# EasyEDA Pro project ProPrj_Codex_key_2026-10-20_10-08-15_2026-11-04.epro, schematic CpuSchematic1

## Sheets
1 P1: Assembly Variant: Basic; Board Name: Board2; Create Date: 2026-10-20; Page Name: P1; Project Name: Codex_key_2026-10-20_10-08-15; Schematic Name: Schematic1; Update Date: 2026-10-20; Company: 嘉立创EDA; Page Size: A4; Version: V1.0
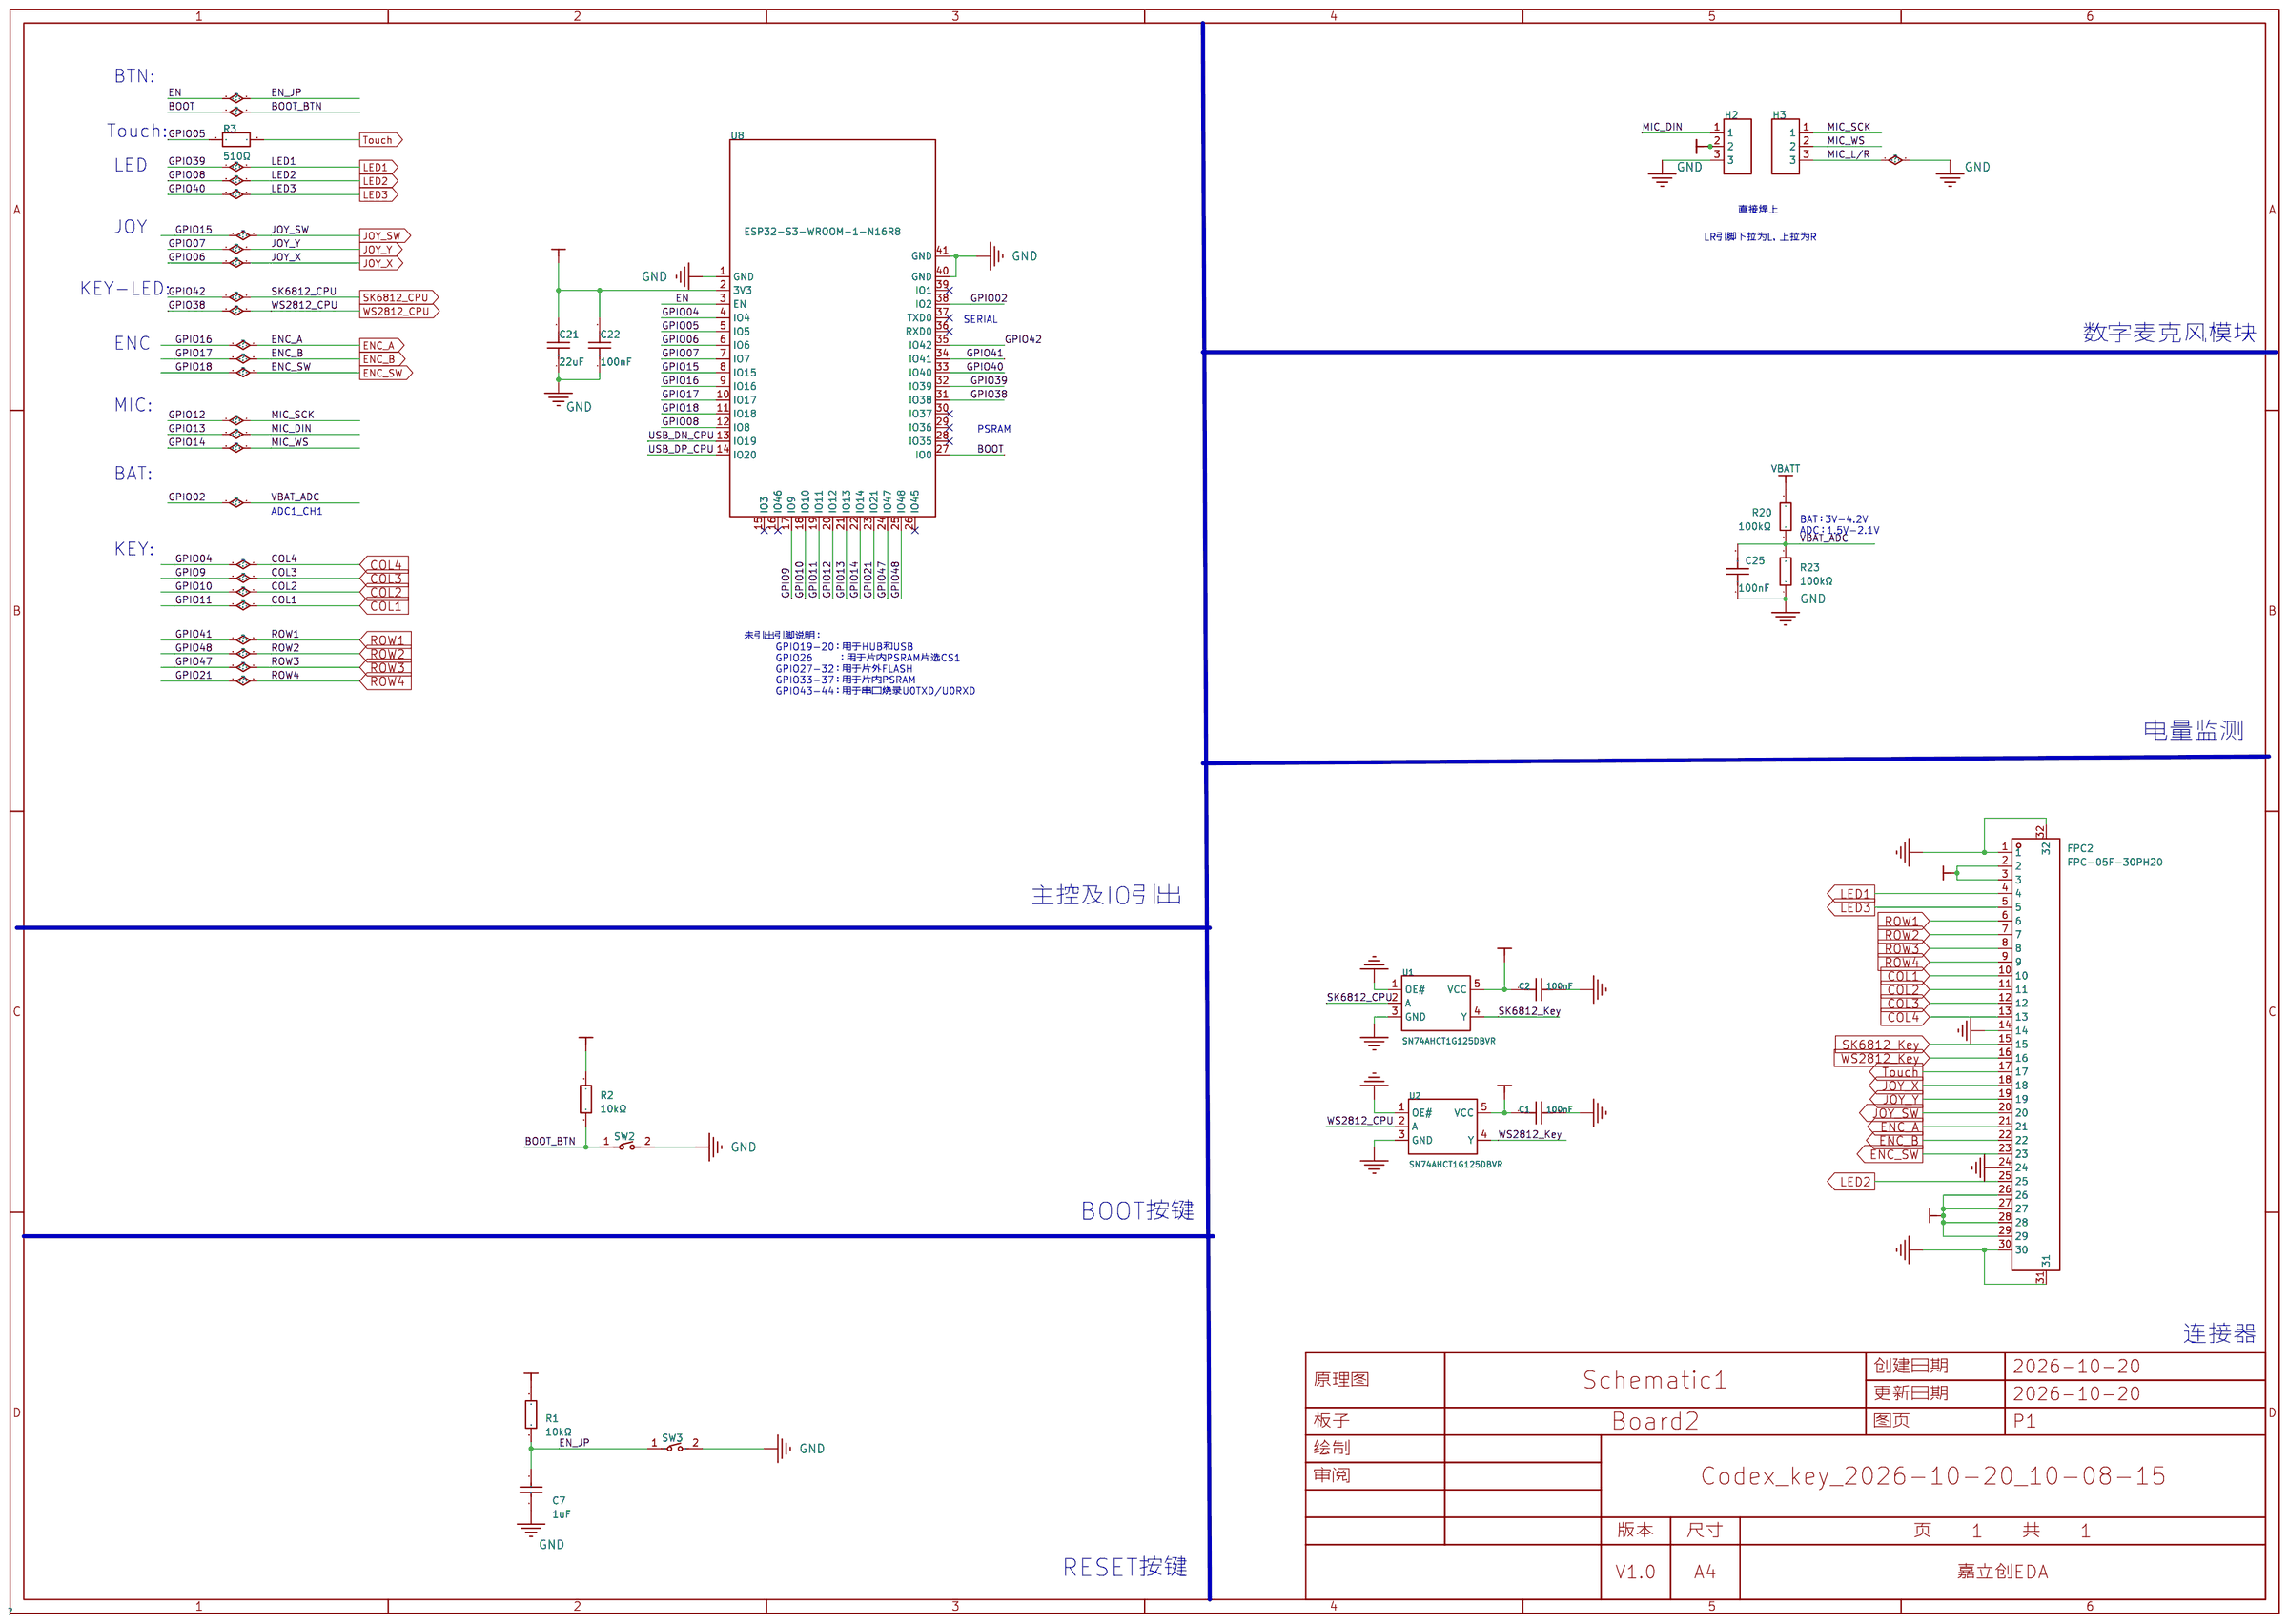
[diagram p2: P1]
2 P2: Board Name: CpuBoard2; Page Name: P2; Schematic Name: CpuSchematic1
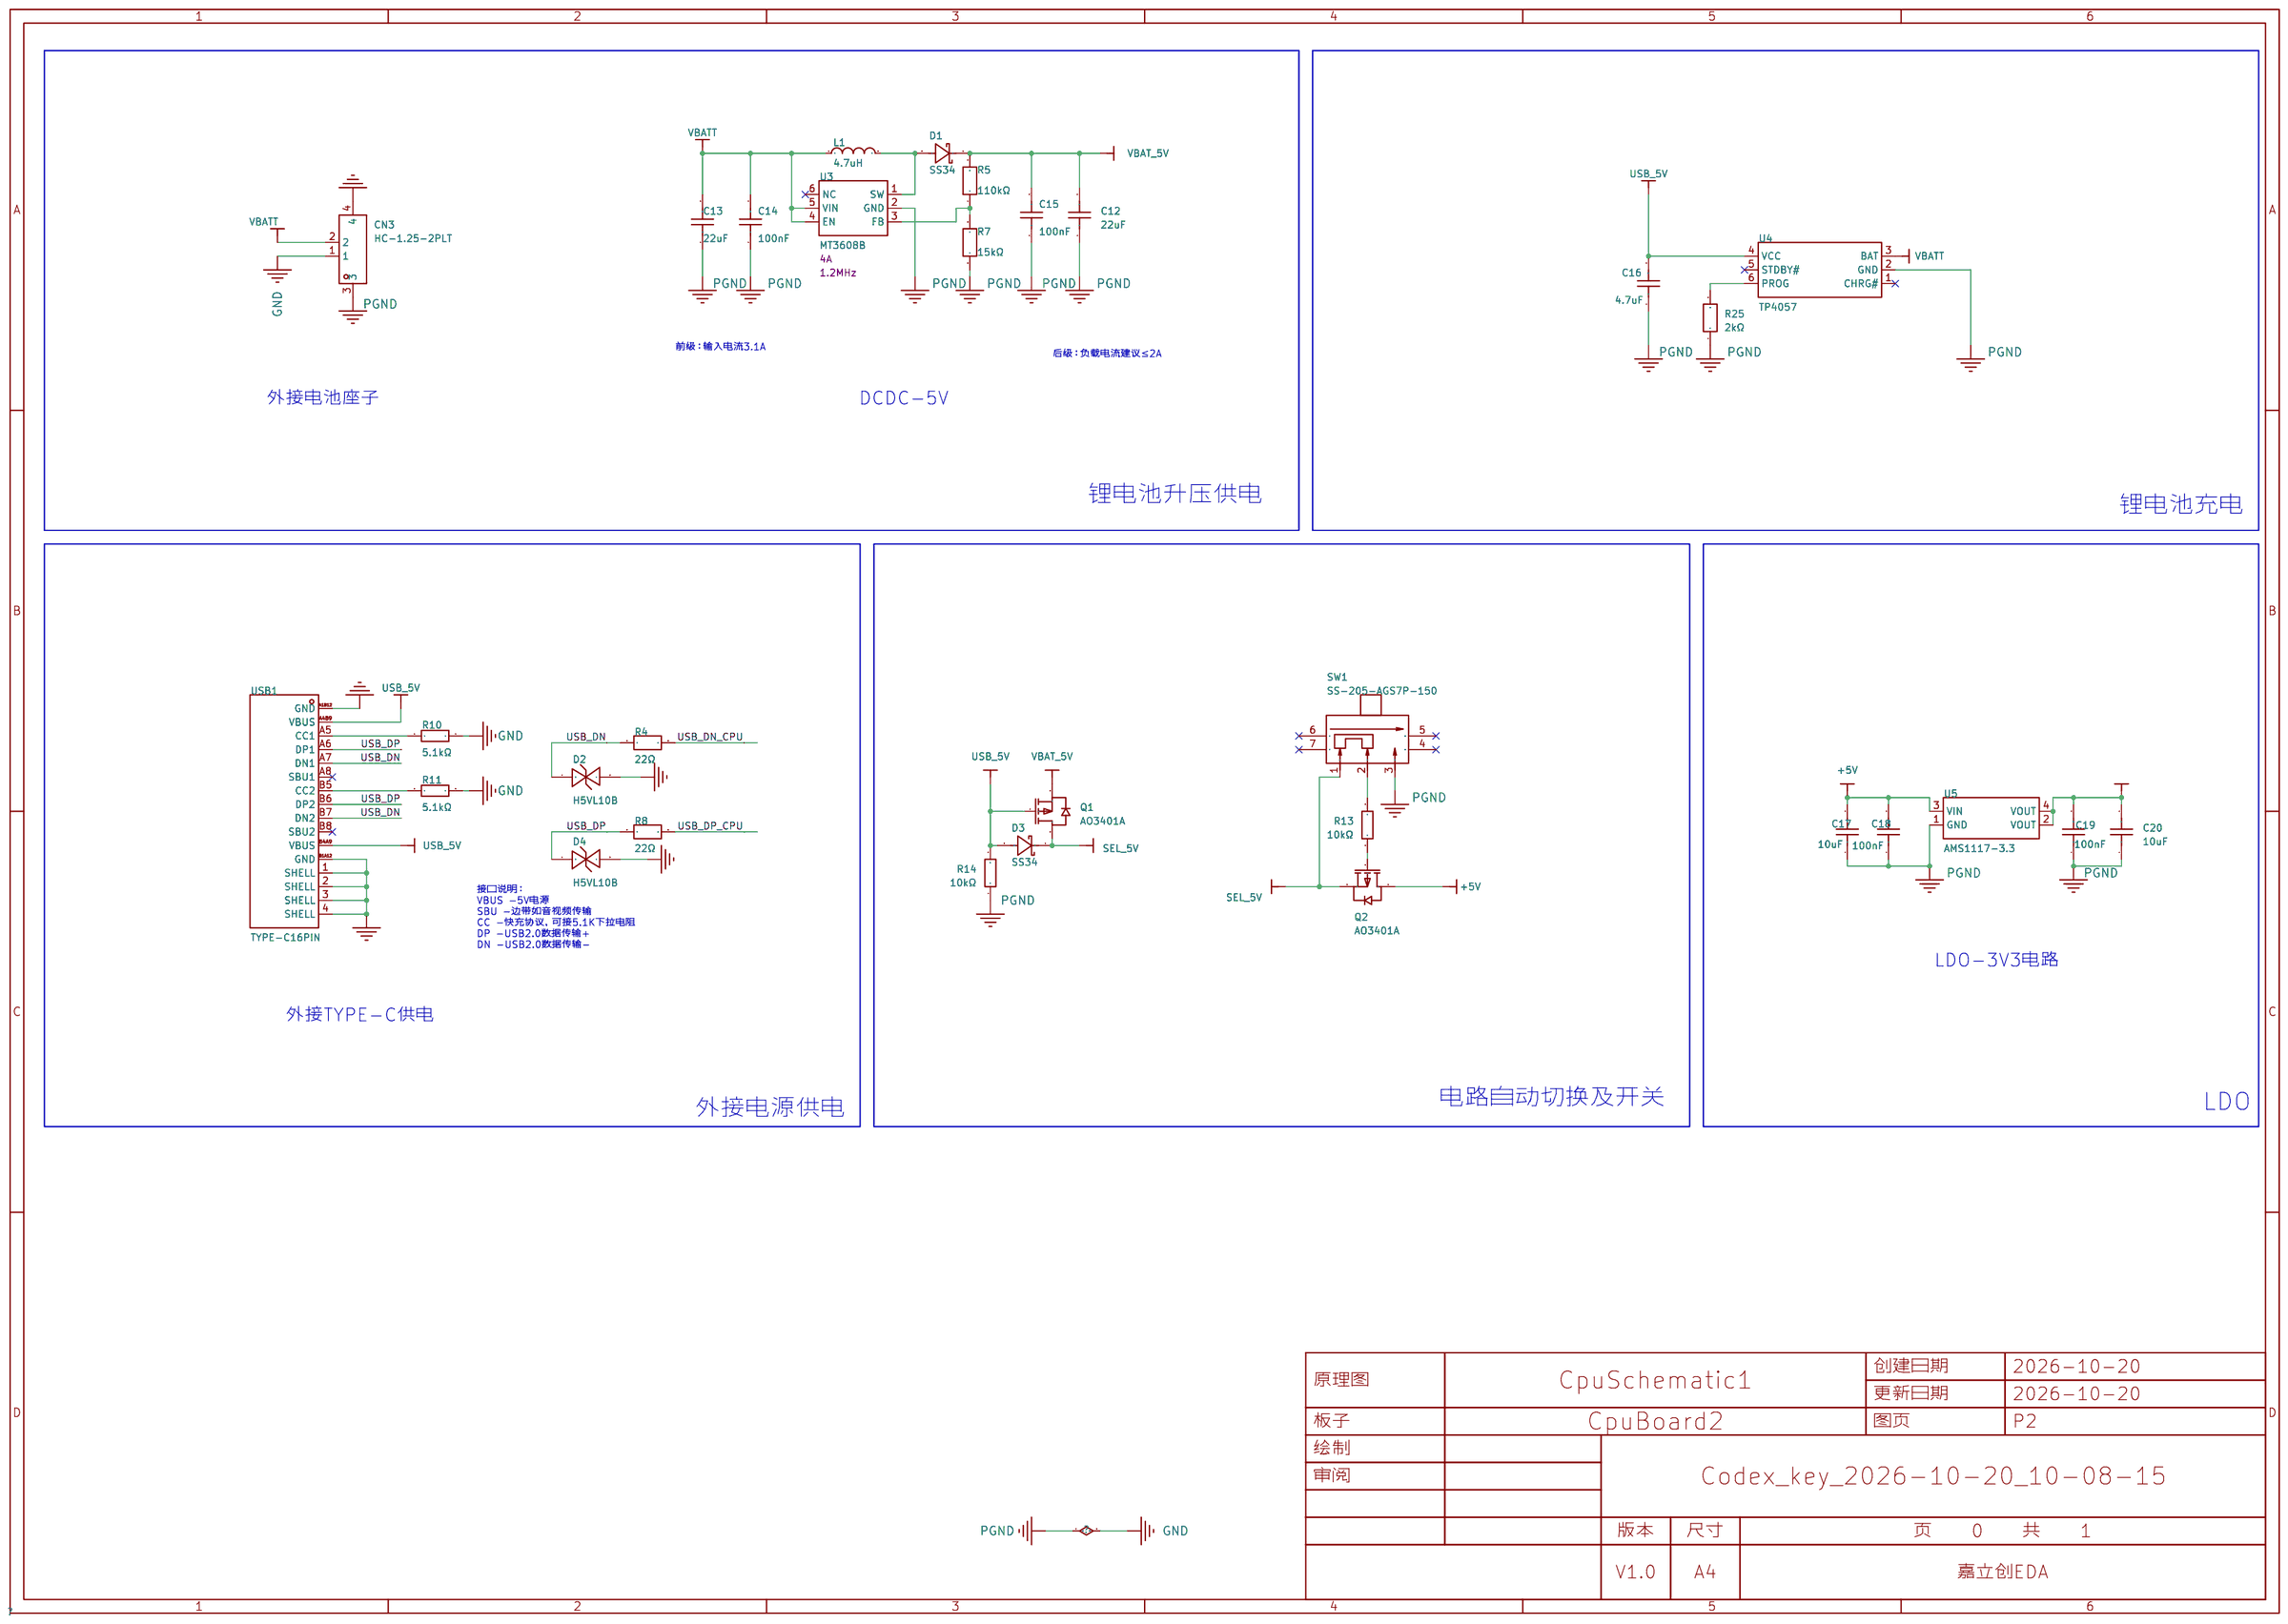
[diagram p3: P2]

## Parts
sheet P1
C1  100nF  [C0603]
C2  100nF  [C0603]
C7  1uF  [C0402]
C21  22uF  [C0603]
C22  100nF  [C0603]
C25  100nF  [C0603]
FPC2  FPC-05F-30PH20  [FPC-SMD_30P-P0.50_XUNPU_FPC-05F-30PH20]
H2  FH2.54-09-03PZD  [HDR-TH_3P-P2.54-V-F]  (no BOM)
H3  FH2.54-09-03PZD  [HDR-TH_3P-P2.54-V-F]  (no BOM)
R1  10kΩ  [R0402]
R2  10kΩ  [R0402]
R3  510Ω  [R0402]
R20  100kΩ  [R0603]
R23  100kΩ  [R0603]
SW2  ZX-QC34-2TPDZ  [KEY-SMD_L3.9-W3.0-LS5.0-EH]
SW3  ZX-QC34-2TPDZ  [KEY-SMD_L3.9-W3.0-LS5.0-EH]
U1  SN74AHCT1G125DBVR  [SOT-23-5_L3.0-W1.7-P0.95-LS2.8-BR]
U2  SN74AHCT1G125DBVR  [SOT-23-5_L3.0-W1.7-P0.95-LS2.8-BR]
U8  ESP32-S3-WROOM-1-N16R8  [WIRELM-SMD_ESP32-S3-WROOM-1]
sheet P2
C12  22uF  [C0603]
C13  22uF  [C0603]
C14  100nF  [C0603]
C15  100nF  [C0603]
C16  4.7uF  [C0603]
C17  10uF  [C0603]
C18  100nF  [C0603]
C19  100nF  [C0603]
C20  10uF  [C0603]
CN3  HC-1.25-2PLT  [CONN-SMD_HC-1.25-2PLT]
D1  SS34  [SMA_L4.2-W2.7-LS5.0-RD]
D2  H5VL10B  [SOD-882_L1.0-W0.6-BI]
D3  SS34  [SMA_L4.2-W2.7-LS5.0-RD]
D4  H5VL10B  [SOD-882_L1.0-W0.6-BI]
L1  4.7uH  [IND-SMD_L4.0-W4.0_LVS404018]
Q1  AO3401A  [SOT-23_L2.9-W1.3-P1.90-LS2.4-BR]
Q2  AO3401A  [SOT-23_L2.9-W1.3-P1.90-LS2.4-BR]
R4  22Ω  [R0402]
R5  110kΩ  [R0603]
R7  15kΩ  [R0603]
R8  22Ω  [R0402]
R10  5.1kΩ  [R0603]
R11  5.1kΩ  [R0603]
R13  10kΩ  [R0603]
R14  10kΩ  [R0603]
R25  2kΩ  [R0603]
SW1  SS-205-AGS7P-150  [SW-SMD_SS-205-AGS7P-150]
U3  MT3608B  [SOT-23-6_L2.9-W1.6-P0.95-LS2.8-BR]
U4  TP4057  [SOT-23-6_L2.9-W1.6-P0.95-LS2.8-BL]
U5  AMS1117-3.3  [SOT-223-3_L6.7-W3.7-P2.30-LS7.0-BR]
USB1  TYPE-C16PIN  [USB-C-SMD_TYPE-C16PIN]

## Library data of the parts
C1 C2 = CC0603KRX7R9BB104: 容值:100nF;精度:±10%;额定电压:50V;温度系数:X7R;; LCSC Part Name: 100nF ±10% 50V; Supplier Part: C14663; Manufacturer: YAGEO(国巨); Supplier Footprint: 0603; JLCPCB Part Class: Basic Part; Datasheet: https://item.szlcsc.com/datasheet/CC0603KRX7R9BB104/15331.html; Supplier: LCSC; Tolerance: ±10%; Voltage Rating: 50V; Temperature Coefficient: X7R
C7 = CL05B104KO5NNNC: 容值:100nF;精度:±10%;额定电压:16V;材质(温度系数):X7R;; LCSC Part Name: 100nF ±10% 16V; Supplier Part: C52923; Manufacturer: SAMSUNG(三星); Manufacturer Part: CL05A105KA5NQNC; Supplier Footprint: 0402; Datasheet: https://atta.szlcsc.com/upload/public/pdf/source/20160218/1457707763339.pdf; Supplier: LCSC; Tolerance: ±10%; Voltage Rated: 16V; Temperature Coefficient: X7R; Check: true
C21 = CL10A226MP8NUNE: 容值:22uF;精度:±20%;额定电压:10V;材质(温度系数):X5R;; LCSC Part Name: 22uF ±20% 10V; Supplier Part: C86295; Manufacturer: SAMSUNG(三星); Supplier Footprint: 0603; JLCPCB Part Class: Extended Part; Datasheet: https://atta.szlcsc.com/upload/public/pdf/source/20160218/1457707763339.pdf; Supplier: LCSC; Tolerance: ±20%; Voltage Rated: 10V; Temperature Coefficient: X5R
C18 C19 C22 = CL10B104KB8NNNC: 容值:100nF;精度:±10%;额定电压:50V;材质(温度系数):X7R;; LCSC Part Name: 100nF ±10% 50V; Supplier Part: C1591; Manufacturer: SAMSUNG(三星); Supplier Footprint: 0603; JLCPCB Part Class: Extended Part; Datasheet: https://atta.szlcsc.com/upload/public/pdf/source/20160218/1457707763339.pdf; Supplier: LCSC; Tolerance: ±10%; Voltage Rated: 50V; Temperature Coefficient: X7R
C14 C15 C25 = CL10B104KB8NNNC: 容值:100nF;精度:±10%;额定电压:50V;温度系数:X7R;; LCSC Part Name: 100nF ±10% 50V; Supplier Part: C1591; Manufacturer: SAMSUNG(三星); Supplier Footprint: 0603; JLCPCB Part Class: Extended Part; Datasheet: https://item.szlcsc.com/datasheet/CL10B104KB8NNNC/1943.html; Supplier: LCSC; Tolerance: ±10%; Voltage Rated: 50V; Temperature Coefficient: X7R; Voltage Rating: 50V
FPC2 = FPC-05F-30PH20: 锁定特性:翻盖式;触点类型:下接;触点数量:30P;间距:0.5mm;安装方式:卧贴;工作温度:-25℃~+85℃;; LCSC Part Name: 翻盖式 下接 P数:30P 间距:0.5mm; Supplier Part: C2856808; Manufacturer: XUNPU(讯普); Supplier Footprint: SMD,P=0.5mm,卧贴; JLCPCB Part Class: Extended Part; Datasheet: https://item.szlcsc.com/datasheet/FPC-05F-30PH20/3056906.html; Supplier: LCSC; Locking Feature: 翻盖式; Contact Type: 下接; Number of Contacts: 30P; Pitch: 0.5mm; Mounting Type: 卧贴; FFC, FCB Thickness: 0.3mm; Height Above Board: 2mm; Contact Material: 磷青铜; Contact Plating: 锡; Operating Temperature: -25℃~+85℃; Rated Voltage (Max): 50V; Current Rating (Max): 500mA
H2 H3 = FH2.54-09-03PZD: 插孔结构:1x3P;间距:2.54mm;圆孔/方孔:方孔;安装方式:直插;排数:单排;总孔位数:3P;额定电流:3A;插孔方向:顶部;塑高:8.5mm;触头材质:磷青铜;触头镀层:金;工作温度:-40℃~+105℃;; LCSC Part Name: 1x3P 间距:2.54mm 直插; Supplier Part: C7500772; Manufacturer: XUNPU(讯普); Supplier Footprint: 插件,P=2.54mm; JLCPCB Part Class: Extended Part; Datasheet: https://item.szlcsc.com/datasheet/FH2.54-09-03PZD/8579576.html; Supplier: LCSC; Holes Structure: 1x3P; Pitch: 2.54mm; Circular Hole / Square Hole: 方孔; Mounting Type: 直插; Number of Rows: 单排; Number of Positions: 3P; Current Rating: 3A; Holes Direction: 顶部; Insulation Height: 8.5mm; Contact Material: 磷青铜; Contact Plating: 金; Operating Temperature: -40℃~+105℃; PIN Length: 3.2mm
R1 R2 = 0402WGF1002TCE: 电阻类型:厚膜电阻;阻值:10kΩ;精度:±1%;功率:62.5mW;温度系数:±100ppm/℃;; LCSC Part Name: 厚膜电阻 10kΩ ±1% 62.5mW; Supplier Part: C25744; Manufacturer: UNI-ROYAL(厚声); Supplier Footprint: 0402; Datasheet: https://atta.szlcsc.com/upload/public/pdf/source/20200306/C422600_1E6D84923E4A46A82E41ADD87F860B5C.pdf; Supplier: LCSC; Type: 厚膜电阻; Tolerance: ±1%; Power(Watts): 62.5mW; Temperature Coefficient: ±100ppm/℃; Overload Voltage (Max): 50V; Operating Temperature Range: -55℃~+155℃; Check: true
R3 = FRC0402F5100TS: 电阻类型:厚膜电阻;阻值:510Ω;精度:±1%;功率:62.5mW;工作电压:50V;温度系数:±100ppm/℃;; LCSC Part Name: 510Ω ±1% 62.5mW 厚膜电阻; Supplier Part: C2909366; Manufacturer: FOJAN(富捷); Supplier Footprint: 0402; JLCPCB Part Class: Extended Part; Datasheet: https://item.szlcsc.com/datasheet/FRC0402F5100TS/3186301.html; Supplier: LCSC; Type: 厚膜电阻; Tolerance: ±1%; Power(Watts): 62.5mW; Voltage-Supply(Max): 50V; Temperature Coefficient: ±100ppm/℃; Operating Temperature: -55℃~+155℃
R20 R23 = FRC0603J104 TS: 电阻类型:厚膜电阻;阻值:100kΩ;精度:±5%;功率:100mW;工作电压:75V;温度系数:±100ppm/℃;; LCSC Part Name: 100kΩ ±5% 100mW 厚膜电阻; Supplier Part: C2907088; Manufacturer: FOJAN(富捷); Supplier Footprint: 0603; JLCPCB Part Class: Extended Part; Datasheet: https://item.szlcsc.com/datasheet/FRC0603J104%2520TS/3180601.html; Supplier: LCSC; Type: 厚膜电阻; Tolerance: ±5%; Power(Watts): 100mW; Voltage-Supply(Max): 75V; Temperature Coefficient: ±100ppm/℃; Operating Temperature: -55℃~+155℃
SW2 SW3 = ZX-QC34-2TPDZ: 电路结构:单刀单掷;按钮形状:圆形按钮;作用力:2.6N;安装方式:立贴;开关长度:3mm;开关宽度:4mm;开关高度:2mm;带支架:不带支架;触点电流:50mA;额定电压:12V;工作寿命:10万次;; LCSC Part Name: 3*4*2贴片开关带柱; Supplier Part: C7470219; Manufacturer: Megastar(兆星); Supplier Footprint: SMD,4x3mm; JLCPCB Part Class: Extended Part; Datasheet: https://item.szlcsc.com/datasheet/ZX-QC34-2TPDZ/8519225.html; Supplier: LCSC; Circuit: 单刀单掷; Actuator Style: 圆形按钮; Operating Force: 2.6N; Mounting Type: 立贴; Length: 3mm; Width: 4mm; Switch Height: 2mm; with Bracket: 不带支架; Contact Current: 50mA; Voltage Rating: 12V; Actuator/Cap Color: 黑色; Termination Style: 鸥翼型; Life: 10万次; Operating Temperature: -30℃~+80℃
U1 U2 = SN74AHCT1G125DBVR: 输入类型:-;工作电压:4.5V~5.5V;元件数:1;每个元件位数:1;灌电流(IOL):8mA;拉电流(IOH):8mA;; LCSC Part Name: 三态输出，单路总线缓冲门; Supplier Part: C7484; Manufacturer: TI(德州仪器); Supplier Footprint: SOT-23-5; JLCPCB Part Class: Extended Part; Datasheet: https://www.ti.com/cn/lit/ds/symlink/sn74ahct1g125.pdf; Supplier: LCSC; output type: 三态; Voltage - Supply: 4.5V~5.5V; Number of Elements: 1; Number of Bits per Element: 1; Channel Type: 单向; Current - Output Low(IOL): 8mA; Current - Output High(IOH): 8mA; Logic Family: 74AHCT; Operating Temperature: -40℃~+125℃; Quiescent Current: 10uA; Propagation Delay: 6.5ns@5V,15pF; Features: 输出使能
U8 = ESP32-S3-WROOM-1-N16R8: LCSC Part Name: 通用型Wi-Fi+低功耗蓝牙MCU模组; Supplier Part: C2913202; Manufacturer: ESPRESSIF(乐鑫); Supplier Footprint: SMD,18x25.5mm; JLCPCB Part Class: 扩展库; Datasheet: https://item.szlcsc.com/datasheet/ESP32-S3-WROOM-1-N16R8/3198300.html; Supplier: LCSC
C12 C13 = CL10A226MP8NUNE: 容值:22uF;精度:±20%;额定电压:10V;材质(温度系数):X5R;; LCSC Part Name: 22uF ±20% 10V; Supplier Part: C86295; Manufacturer: SAMSUNG(三星); Supplier Footprint: 0603; JLCPCB Part Class: 扩展库; Datasheet: https://atta.szlcsc.com/upload/public/pdf/source/20160218/1457707763339.pdf; Supplier: LCSC; Tolerance: ±20%; Voltage Rated: 10V; Temperature Coefficient: X5R
C16 = CL10A475KO8NNNC: 容值:4.7uF;精度:±10%;额定电压:16V;材质(温度系数):X5R;; LCSC Part Name: 4.7uF ±10% 16V; Supplier Part: C19666; Manufacturer: SAMSUNG(三星); Supplier Footprint: 0603; JLCPCB Part Class: 基础库; Datasheet: https://atta.szlcsc.com/upload/public/pdf/source/20160218/1457707763339.pdf; Supplier: LCSC; Tolerance: ±10%; Voltage Rated: 16V; Temperature Coefficient: X5R
C17 C20 = CL10A106KP8NNNC: 容值:10uF;精度:±10%;额定电压:10V;材质(温度系数):X5R;; LCSC Part Name: 10uF ±10% 10V; Supplier Part: C19702; Manufacturer: SAMSUNG(三星); Supplier Footprint: 0603; JLCPCB Part Class: Basic Part; Datasheet: https://atta.szlcsc.com/upload/public/pdf/source/20160218/1457707763339.pdf; Supplier: LCSC; Tolerance: ±10%; Voltage Rated: 10V; Temperature Coefficient: X5R
CN3 = HC-1.25-2PLT: 插针结构:1x2P;间距:1.25mm;安装方式:立贴;参考系列:PicoBlade(MX 1.25);总PIN数:2P;排数:1;每排PIN数:2;行距:-;额定电流:2A;触头材质:黄铜;触头镀层:锡;工作温度范围:-25℃~+85℃;; LCSC Part Name: 1x2P 间距:1.25mm 立贴 系列:PicoBlade(MX 1.25); Supplier Part: C2845388; Manufacturer: HCTL(华灿天禄); Supplier Footprint: SMD,P=1.25mm; JLCPCB Part Class: 扩展库; Datasheet: https://atta.szlcsc.com/upload/public/pdf/source/20230707/8E5913B5A3195C18F5EE12EA4CB86B82.pdf; Supplier: LCSC; Pins Structure: 1x2P; Pitch: 1.25mm; Mounting Style: 立贴; Reference Series: PicoBlade(MX 1.25); Number of Pins: 2P; Number of Rows: 1; Number of PINs Per Row: 2; Current Rating (Max): 2A; Contact Material: 黄铜; Contact Plating: 锡; Operating Temperature Range: -25℃~+85℃; Rated Voltage (Max): 250V; Plastic Material: LCP; Flame Retardant Rating: UL94V-0; Supplementary Features: 辅助焊脚; Z-Height of the Board: 4.75mm; X-Length of Bottom Edge on Board (Spacing Line): 7.3mm; Y-Width of Bottom Edge on Board: 4.2mm
D1 D3 = SS34_C2837271: 二极管配置:1个独立式;正向压降(Vf):550mV@3A;直流反向耐压(Vr):40V;整流电流:3A;; LCSC Part Name: 电压:40V 电流:3A; Supplier Part: C2837271; Manufacturer: JSMSEMI(杰盛微); Supplier Footprint: SMA(DO-214AC); JLCPCB Part Class: Extended Part; Datasheet: https://item.szlcsc.com/datasheet/SS34/3007843.html; Supplier: LCSC; Diode Configuration: 1个独立式; Voltage - Forward(Vf@If): 550mV@3A; Voltage - DC Reverse(Vr): 40V; Current - Rectified: 3A; Operating Junction Temperature Range: -50℃~+125℃; Non-Repetitive Peak Forward Surge Current: 100A
D2 D4 = H5VL10B: 极性:双向;反向工作电压(Vrwm):5V;钳位电压:10V;峰值脉冲电流(Ipp):5A;峰值脉冲功率(Ppp):50W;击穿电压(VBR):5.6V;; LCSC Part Name: 丝印 PB 双向ESD 5V截止 峰值浪涌电流：5A; Supplier Part: C7420372; Manufacturer: R+O(宏嘉诚); Supplier Footprint: DFN1006-2L; JLCPCB Part Class: Extended Part; Datasheet: https://item.szlcsc.com/datasheet/H5VL10B/8397194.html; Supplier: LCSC; Polarity: 双向; Reverse Stand-Off Voltage (Vrwm): 5V; Clamping Voltage: 10V; Peak Pulse Current (Ipp): 5A; Peak Pulse Power Dissipation (Ppp): 50W; Voltage - Breakdown: 5.6V; Reverse Leakage Current (Ir): 100nA; Number of Channels: 单路; Operating Temperature: -55℃~+125℃; level of protection: IEC 61000-4-2；IEC 61000-4-5; Type: ESD; Junction Capacitance: 15pF
L1 = PNR4020-4R7-M: 电感值:4.7uH;精度:±20%;额定电流:2A;饱和电流(Isat):2.5A;类型:磁胶屏蔽电感;; LCSC Part Name: 4.7uH±20% 2.5A; Supplier Part: C55381750; Manufacturer: JIERR(捷而瑞); Supplier Footprint: SMD,4x4mm; JLCPCB Part Class: Extended Part; Datasheet: https://item.szlcsc.com/datasheet/PNR4020-4R7-M/59339378.html; Supplier: LCSC; Tolerance: ±20%; Current Rating: 2A; Current - Saturation(Isat): 2.5A; DC Resistance(DCR): 75mΩ; Type: 磁胶屏蔽电感
Q1 Q2 = AO3401A_C347476: 数量:1个P沟道;漏源电压(Vdss):30V;连续漏极电流(Id):4.2A;导通电阻(RDS(on)):50mΩ@10V;耗散功率(Pd):1.4W;阈值电压(Vgs(th)):1.3V@250uA;; LCSC Part Name: 1个P沟道 耐压:30V 电流:4.2A; Supplier Part: C347476; Manufacturer: UMW(友台半导体); Supplier Footprint: SOT-23; JLCPCB Part Class: 扩展库; Datasheet: https://atta.szlcsc.com/upload/public/pdf/source/20250624/19C0EEFA712C89E784A9E10025849464.pdf; Supplier: LCSC; Number: 1个P沟道; Drain to Source Voltage: 30V; Current - Continuous Drain(Id): 4.2A; RDS(on): 50mΩ@10V; Pd - Power Dissipation: 1.4W; Gate Threshold Voltage (Vgs(th)): 1.3V@250uA; Gate Charge(Qg): 9.4nC@4.5V; Input Capacitance(Ciss): 954pF; Reverse Transfer Capacitance (Crss@Vds): 77pF; Operating Temperature: -55℃~+150℃; Type: P沟道; Output Capacitance(Coss): 115pF
R4 R8 = FRC0402F22R0TS: 电阻类型:厚膜电阻;阻值:22Ω;精度:±1%;功率:62.5mW;工作电压:50V;温度系数:±100ppm/℃;; LCSC Part Name: 22Ω ±1% 62.5mW 厚膜电阻; Supplier Part: C2929994; Manufacturer: FOJAN(富捷); Supplier Footprint: 0402; JLCPCB Part Class: Extended Part; Datasheet: https://item.szlcsc.com/datasheet/FRC0402F22R0TS/3266927.html; Supplier: LCSC; Type: 厚膜电阻; Tolerance: ±1%; Power(Watts): 62.5mW; Voltage-Supply(Max): 50V; Temperature Coefficient: ±100ppm/℃; Operating Temperature: -55℃~+155℃
R5 = FRC0603F1103TS: 电阻类型:厚膜电阻;阻值:110kΩ;精度:±1%;功率:100mW;最大工作电压:75V;温度系数:±100ppm/℃;; LCSC Part Name: 110kΩ ±1% 100mW 厚膜电阻; Supplier Part: C2906984; Manufacturer: FOJAN(富捷); Supplier Footprint: 0603; JLCPCB Part Class: 扩展库; Datasheet: https://atta.szlcsc.com/upload/public/pdf/source/20211221/925EC7D7225764EE0046F22065062C87.pdf; Supplier: LCSC; Type: 厚膜电阻; Tolerance: ±1%; Power(Watts): 100mW; Overload Voltage (Max): 75V; Temperature Coefficient: ±100ppm/℃; Operating Temperature Range: -55℃~+155℃
R7 = FRC0603F1502TS: 电阻类型:厚膜电阻;阻值:15kΩ;精度:±1%;功率:100mW;最大工作电压:75V;温度系数:±100ppm/℃;; LCSC Part Name: 15kΩ ±1% 100mW 厚膜电阻; Supplier Part: C2906995; Manufacturer: FOJAN(富捷); Supplier Footprint: 0603; JLCPCB Part Class: 扩展库; Datasheet: https://atta.szlcsc.com/upload/public/pdf/source/20211221/925EC7D7225764EE0046F22065062C87.pdf; Supplier: LCSC; Type: 厚膜电阻; Tolerance: ±1%; Power(Watts): 100mW; Overload Voltage (Max): 75V; Temperature Coefficient: ±100ppm/℃; Operating Temperature Range: -55℃~+155℃
R10 R11 = 0603WAF5101T5E: 电阻类型:厚膜电阻;阻值:5.1kΩ;精度:±1%;功率:100mW;工作电压:75V;温度系数:±100ppm/℃;; LCSC Part Name: 5.1kΩ ±1% 100mW 厚膜电阻; Supplier Part: C23186; Manufacturer: UNI-ROYAL(厚声); Supplier Footprint: 0603; JLCPCB Part Class: 基础库; Datasheet: https://item.szlcsc.com/datasheet/0603WAF5101T5E/23913.html; Supplier: LCSC; Type: 厚膜电阻; Tolerance: ±1%; Power(Watts): 100mW; Voltage-Supply(Max): 75V; Temperature Coefficient: ±100ppm/℃; Operating Temperature: -55℃~+155℃
R13 = FRC0603J103 TS: 电阻类型:厚膜电阻;阻值:10kΩ;精度:±5%;功率:100mW;工作电压:75V;温度系数:±100ppm/℃;; LCSC Part Name: 10kΩ ±5% 100mW 厚膜电阻; Supplier Part: C2930027; Manufacturer: FOJAN(富捷); Supplier Footprint: 0603; JLCPCB Part Class: Extended Part; Supplier: LCSC; Type: 厚膜电阻; Tolerance: ±5%; Power(Watts): 100mW; Voltage-Supply(Max): 75V; Temperature Coefficient: ±100ppm/℃; Operating Temperature: -55℃~+155℃
R14 = FRC0603J103 TS: 电阻类型:厚膜电阻;阻值:10kΩ;精度:±5%;功率:100mW;工作电压:75V;温度系数:±100ppm/℃;; LCSC Part Name: 10kΩ ±5% 100mW 厚膜电阻; Supplier Part: C2930027; Manufacturer: FOJAN(富捷); Supplier Footprint: 0603; JLCPCB Part Class: Extended Part; Datasheet: https://item.szlcsc.com/datasheet/FRC0603J103%2520TS/3266960.html; Supplier: LCSC; Type: 厚膜电阻; Tolerance: ±5%; Power(Watts): 100mW; Voltage-Supply(Max): 75V; Temperature Coefficient: ±100ppm/℃; Operating Temperature: -55℃~+155℃
R25 = FRC0603J202 TS: 电阻类型:厚膜电阻;阻值:2kΩ;精度:±5%;功率:100mW;工作电压:75V;温度系数:±100ppm/℃;; LCSC Part Name: 2kΩ ±5% 100mW 厚膜电阻; Supplier Part: C2907137; Manufacturer: FOJAN(富捷); Supplier Footprint: 0603; JLCPCB Part Class: 扩展库; Supplier: LCSC; Type: 厚膜电阻; Tolerance: ±5%; Power(Watts): 100mW; Voltage-Supply(Max): 75V; Temperature Coefficient: ±100ppm/℃; Operating Temperature: -55℃~+155℃
SW1 = SS-205-AGS7P-150: LCSC Part Name: 卧式侧拨迷你七脚 贴片滑动开关 二档微型拨动开关 柄高1.5mm; Supplier Part: C42377849; Manufacturer: XUNPU(讯普); Supplier Footprint: SMD-7P,5x1.4mm; JLCPCB Part Class: Extended Part; Datasheet: https://item.szlcsc.com/datasheet/SS-205-AGS7P-150/44278016.html; Supplier: LCSC
U3 = MT3608B: 功能类型:升压型;输出类型:可调;工作电压:2.5V~24V;输出电压:-;输出电流:4A;; LCSC Part Name: 高效1.2MHz升压转换器; Supplier Part: C19189893; Manufacturer: 西安航天民芯; Supplier Footprint: SOT-23-6; JLCPCB Part Class: Extended Part; Datasheet: https://atta.szlcsc.com/upload/public/pdf/source/20231108/A2E6FFA724546D8334EF0FC1E6740EDE.pdf; Supplier: LCSC; Function: 升压型; Output Type: 可调; Voltage - Supply: 2.5V~24V; Output Current: 4A; Frequency - Switching: 1.2MHz; Operating Temperature: -40℃~+85℃; Synchronous Rectifier: 否; Number of Outputs: 1; Topology: 升压式; Quiescent Current: 70uA; Switch tube (built-in/external): 内置
U4 = TP4057_C440390: 工作电压:4.5V~5.5V;最大充电电流:600mA;电池类型:锂离子/聚合物;电池节数:1;; LCSC Part Name: 0.6A锂电池充电IC; Supplier Part: C440390; Manufacturer: TPOWER(天源); Supplier Footprint: SOT-23-6; JLCPCB Part Class: 扩展库; Datasheet: https://atta.szlcsc.com/upload/public/pdf/source/20240125/67017B4E04B985FD14A311A704D30FFB.pdf; Supplier: LCSC; The Chip Type: 线性充电芯片; Voltage - Supply: 4.5V~5.5V; Charge Current - Max: 600mA; Charging Saturation Voltage: 4.2V; Type of Battery: 锂离子/聚合物; Number of Cells: 1; Operating Temperature: -40℃~+85℃
U5 = AMS1117-3.3_C18164485: 输出类型:固定;工作电压:15V;输出电压:3.3V;输出电流:1A;电源纹波抑制比(PSRR):75dB@(120Hz);输出极性:正极;; Supplier Part: C18164485; Manufacturer: GR(国睿); Supplier Footprint: SOT-223; JLCPCB Part Class: 扩展库; Datasheet: https://atta.szlcsc.com/upload/public/pdf/source/20230915/94CBA0DE456537EBE1AFE762E38F0E43.pdf; Supplier: LCSC; Output Type: 固定; Maximum Input Voltage: 15V; Output Voltage: 3.3V; Output Current: 1A; Power Supply Rejection Ratio (PSRR): 75dB@(120Hz); Dropout Voltage: 1.2V@(1A); standby current: 5mA; Feature: 热保护(TSD)；过流保护(OCP); Output Polarity: 正极; Number of Outputs: 1
USB1 = TYPE-C16PIN: 连接器类型:Type-C;标准:-;公母:母;端口数量:1;触点数量:16P;安装方式:卧贴;额定电流 - 电源:3A;工作温度范围:-40℃~+85℃;; LCSC Part Name: Type-C 母 卧贴; Supplier Part: C393939; Manufacturer: SHOU HAN(首韩); Supplier Footprint: SMD; JLCPCB Part Class: 扩展库; Datasheet: https://atta.szlcsc.com/upload/public/pdf/source/20190521/C393939_7B9043D4CF1026AF443AB60D91FBCD5C.pdf; Supplier: LCSC; Connector Type: Type-C; Gender: 母; Number of Ports: 1; Number of Contacts: 16P; Mounting Style: 卧贴; Current Rating - Power (Max): 3A; Operating Temperature Range: -40℃~+85℃

## Nets
+5V: C1.1 C2.1 C17.2 C18.2 FPC2.26 FPC2.27 FPC2.28 FPC2.29 Q2.3(D) U1.5(VCC) U2.5(VCC) U5.3(VIN)
GND: C1.2 C2.2 C7.2 C12.1 C13.1 C14.1 C15.1 C16.1 C17.1 C18.1 C19.1 C20.1 C21.1 C22.1 C25.1 CN3.1 CN3.3 CN3.4 D2.2(A) D4.2(A) FPC2.1 FPC2.14 FPC2.24 FPC2.30 FPC2.31 FPC2.32 H2.3 H3.3 R7.1 R10.1 R11.1 R14.1 R23.1 R25.1 SW1.3 SW2.2 SW3.2 U1.1(OE#) U1.3(GND) U2.1(OE#) U2.3(GND) U3.2(GND) U4.2(GND) U5.1(GND) U8.1(GND) U8.40(GND) U8.41(GND) USB1.1(SHELL) USB1.2(SHELL) USB1.3(SHELL) USB1.4(SHELL) USB1.A1B12(GND) USB1.B1A12(GND)
VBAT_5V: C12.2 C15.2 D1.1(K) Q1.2(S) R5.2
VBATT: C13.2 C14.2 CN3.2 L1.1 R20.2 U3.4(EN) U3.5(VIN) U4.3(BAT)
VCC: C19.2 C20.2 C21.2 C22.2 FPC2.2 FPC2.3 H2.2 R1.1 R2.1 U5.2(VOUT) U5.4(VOUT) U8.2(3V3)
BOOT: R2.2 SW2.1 U8.27(IO0)
COL1: FPC2.10 U8.19(IO11)
COL2: FPC2.11 U8.18(IO10)
COL3: FPC2.12 U8.17(IO9)
COL4: FPC2.13 U8.4(IO4)
EN: C7.1 R1.2 SW3.1 U8.3(EN)
ENC_A: FPC2.21 U8.9(IO16)
ENC_B: FPC2.22 U8.10(IO17)
ENC_SW: FPC2.23 U8.11(IO18)
GPIO02: C25.2 R20.1 R23.2 U8.38(IO2)
GPIO05: R3.1 U8.5(IO5)
GPIO06: FPC2.18 U8.6(IO6)
GPIO07: FPC2.19 U8.7(IO7)
GPIO08: FPC2.25 U8.12(IO8)
GPIO12: H3.1 U8.20(IO12)
GPIO13: H2.1 U8.21(IO13)
GPIO14: H3.2 U8.22(IO14)
GPIO15: FPC2.20 U8.8(IO15)
GPIO21: FPC2.9 U8.23(IO21)
GPIO38: U2.2(A) U8.31(IO38)
GPIO39: FPC2.4 U8.32(IO39)
GPIO40: FPC2.5 U8.33(IO40)
GPIO41: FPC2.6 U8.34(IO41)
GPIO42: U1.2(A) U8.35(IO42)
GPIO47: FPC2.8 U8.24(IO47)
GPIO48: FPC2.7 U8.25(IO48)
SEL_5V: D3.1(K) Q1.3(D) Q2.2(S) SW1.1
SK6812_Key: FPC2.15 U1.4(Y)
Touch: FPC2.17 R3.2
USB_5V: C16.2 D3.2(A) Q1.1(G) R14.2 U4.4(VCC) USB1.A4B9(VBUS) USB1.B4A9(VBUS)
USB_DN: D2.1(C) R4.1 USB1.A7(DN1) USB1.B7(DN2)
USB_DN_CPU: R4.2 U8.13(IO19)
USB_DP: D4.1(C) R8.1 USB1.A6(DP1) USB1.B6(DP2)
USB_DP_CPU: R8.2 U8.14(IO20)
WS2812_Key: FPC2.16 U2.4(Y)
$2N4: Q2.1(G) R13.1
$2N5: R13.2 SW1.2
$2N18: R25.2 U4.6(PROG)
$2N37: R11.2 USB1.B5(CC2)
$2N38: R10.2 USB1.A5(CC1)
$2N51: R5.1 R7.2 U3.3(FB)
$2N52: D1.2(A) L1.2 U3.1(SW)

Not connected (* = marked no-connect by the designer): SW1 4* 5* 6* 7*; U3 6(NC)*; U4 1(CHRG#)* 5(STDBY#)*; U8 15(IO3)* 16(IO46)* 26(IO45)* 28(IO35)* 29(IO36)* 30(IO37)* 36(RXD0)* 37(TXD0)* 39(IO1)*; USB1 A8(SBU1)* B8(SBU2)*

## Notes on the sheets
sheet 1
- BTN:
- Touch:
- LED
- 直接焊上
- JOY
- LR引脚下拉为L，上拉为R
- KEY-LED:
- SERIAL
- ENC
- 数字麦克风模块
- MIC:
- PSRAM
- BAT:
- ADC1_CH1
- BAT：3V-4.2V
  ADC：1.5V-2.1V
- KEY:
- 未引出引脚说明：
        GPIO19-20：用于HUB和USB
        GPIO26     ：用于片内PSRAM片选CS1
        GPIO27-32：用于片外FLASH
        GPIO33-37：用于片内PSRAM
        GPIO43-44：用于串口烧录U0TXD/U0RXD
- 电量监测
- 主控及IO引出
- BOOT按键
- 连接器
- RESET按键
sheet 2
- 前级：输入电流3.1A
- 后级：负载电流建议≤2A
- 外接电池座子
- DCDC-5V
- 锂电池升压供电
- 锂电池充电
- 接口说明：
  VBUS -5V电源
  SBU -边带如音视频传输
  CC -快充协议，可接5.1K下拉电阻
  DP -USB2.0数据传输+
  DN -USB2.0数据传输-
- LDO-3V3电路
- 外接TYPE-C供电
- 电路自动切换及开关
- LDO
- 外接电源供电
